# Altium project CarnLog-26.PrjPcb (part 1 of 2)
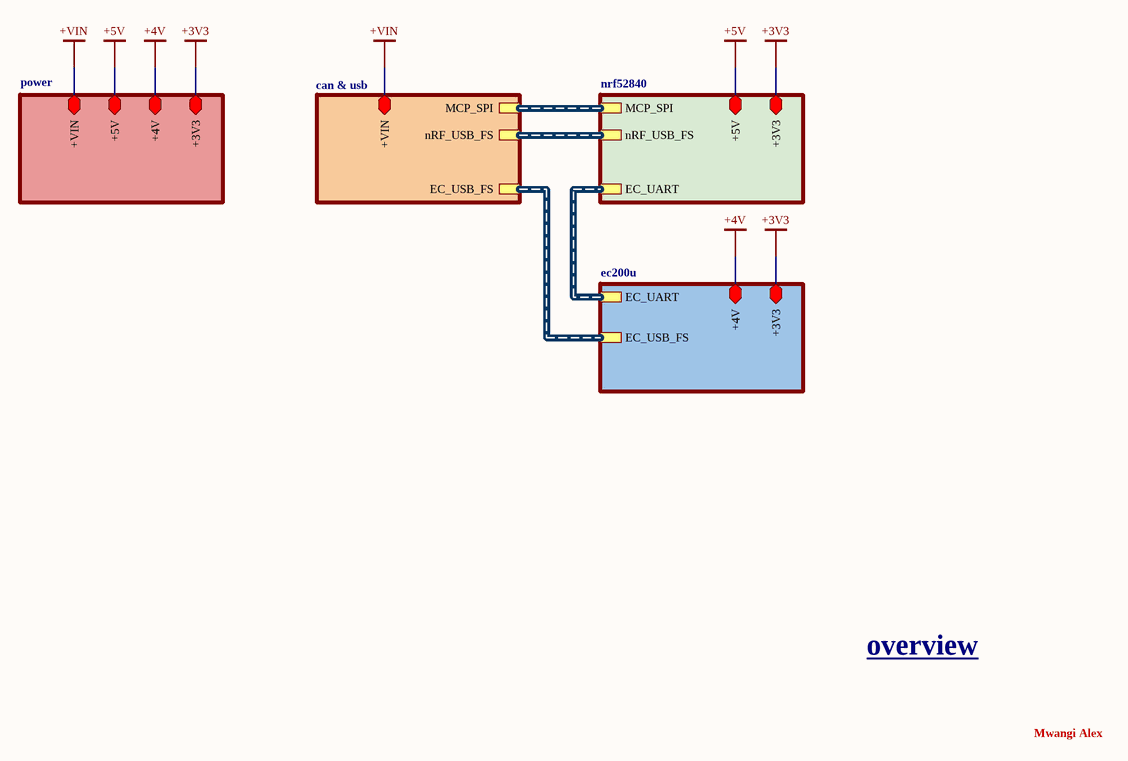
[diagram p0: overview.SchDoc]
5 sheets, 195 parts. Net scope: hierarchical (ports join the sheet entries above them; power ports are global).
Board file: CarnLog-26.PcbDoc
Sheets:
  overview.SchDoc
    power = pwr.SchDoc
    can & usb = can&usb.SchDoc
    nrf52840 = nrf52840.SchDoc
    ec200u = ec200u.SchDoc

## Sheet overview.SchDoc
size A4; SheetNumber: 1; SheetTotal: 5

### Sub-sheets
can & usb = can&usb.SchDoc: MCP_SPI (harness CAN_UART), +VIN (bidir), nRF_USB_FS (harness nRF_USB_FS), EC_USB_FS (harness EC_USB_FS)
ec200u = ec200u.SchDoc: EC_UART (harness EC_UART), +3V3 (bidir), +4V (bidir), EC_USB_FS (harness EC_USB_FS)
nrf52840 = nrf52840.SchDoc: EC_UART (harness EC_UART), MCP_SPI (harness CAN_UART), +3V3 (bidir), nRF_USB_FS (harness nRF_USB_FS), +5V (bidir)
power = pwr.SchDoc: +3V3 (bidir), +5V (bidir), +4V (bidir), +VIN (bidir)

### Nets
+3V3: sheet power/+3V3, sheet nrf52840/+3V3, sheet ec200u/+3V3
+4V: sheet power/+4V, sheet ec200u/+4V
+5V: sheet power/+5V, sheet nrf52840/+5V
+VIN: sheet power/+VIN, sheet can & usb/+VIN

### Buses and harness runs
harness sheet can & usb/EC_USB_FS = sheet ec200u/EC_USB_FS
harness sheet can & usb/MCP_SPI = sheet nrf52840/MCP_SPI
harness sheet can & usb/nRF_USB_FS = sheet nrf52840/nRF_USB_FS
harness sheet ec200u/EC_UART = sheet nrf52840/EC_UART

### Notes on the sheet
- overview
- Mwangi Alex

## Sheet pwr.SchDoc
size OrCAD A; SheetNumber: 2; SheetTotal: 5
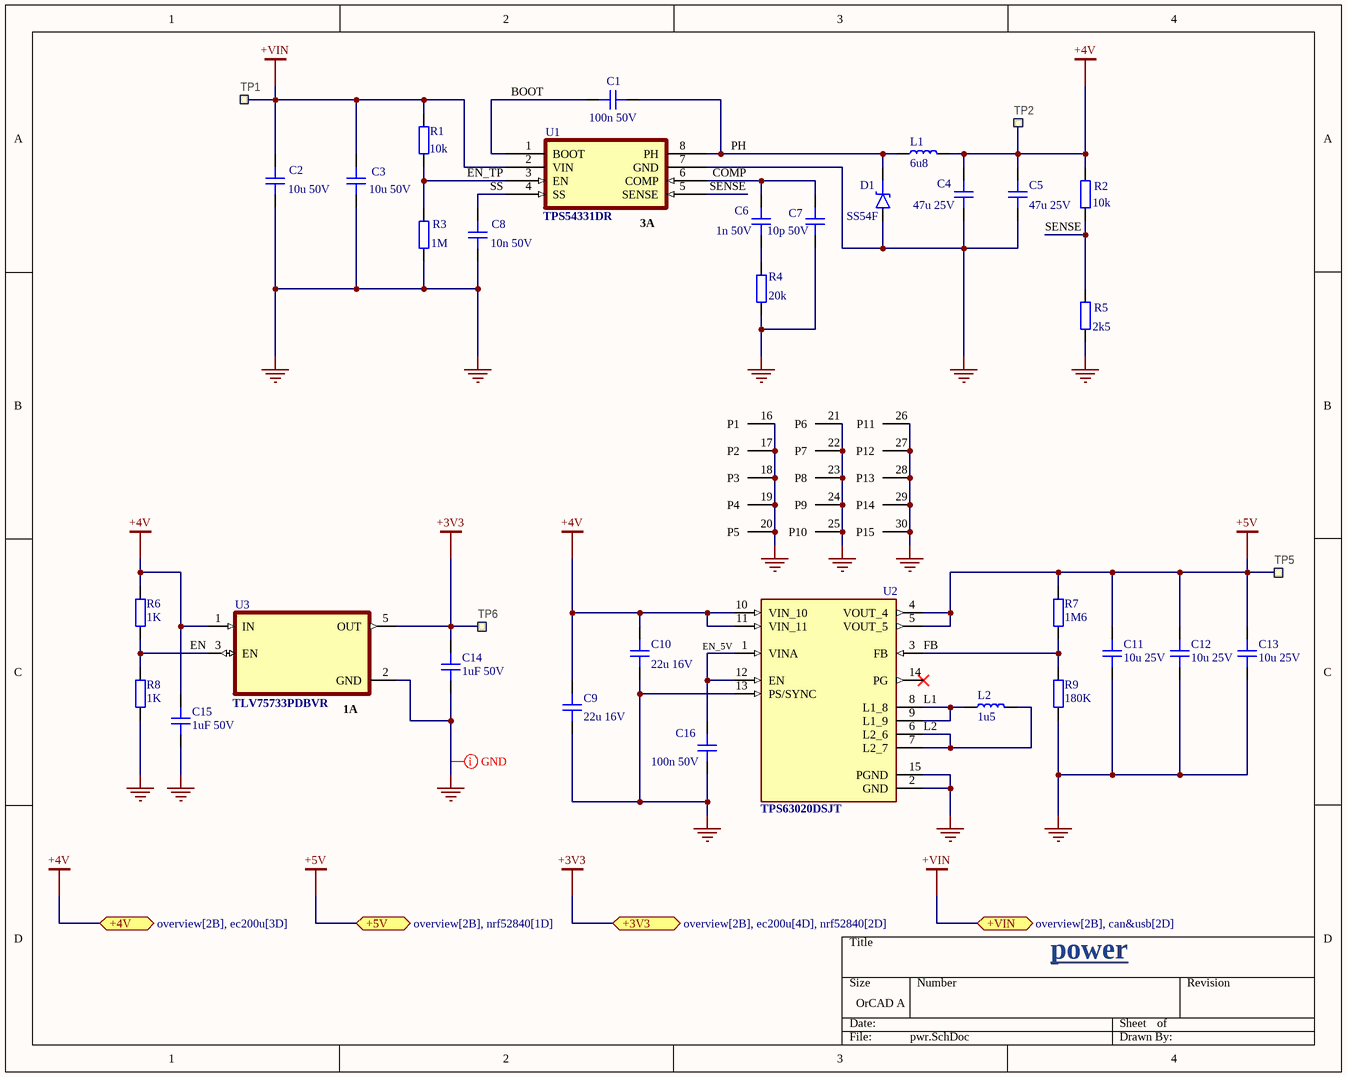
[diagram p1: pwr.SchDoc]

### Parts
C1  100n 50V  [CAP_0402]
C2  10u 50V  [CAP_1206]
C3  10u 50V  [CAP_1206]
C4  47u 25V  [CAP_1206]
C5  47u 25V  [CAP_1206]
C6  1n 50V  [CAP_0603]
C7  10p 50V  [CAP_0402]
C8  10n 50V  [CAP_0603]
C9  22u 16V  [CAP_0603]
C10  22u 16V  [CAP_0603]
C11  10u 25V  [CAP_0603]
C12  10u 25V  [CAP_0603]
C13  10u 25V  [CAP_0603]
C14  1uF 50V  [CAP_0603]
C15  1uF 50V  [CAP_0603]
C16  100n 50V  [CAP_0402]
D1  SS54F  [DIOM5226X100N]
L1  6u8  [ASPI-0630HI-6R8M-T15]
L2  1u5  [IND_1008]
R1  10k  [RES_0603]
R2  10k  [RES_0603]
R3  1M  [RES_0603]
R4  20k  [RES_0603]
R5  2k5  [RES_0603]
R6  1K  [RES_0603]
R7  1M6  [RES_0805]
R8  1K  [RES_0603]
R9  180K  [RES_0805]
TP1  Ø1.0mm,SMD  [TP_SMD_D1.0mm]  (value not drawn)  (no BOM)
TP2  Ø1.0mm,SMD  [TP_SMD_D1.0mm]  (value not drawn)  (no BOM)
TP5  Ø1.0mm,SMD  [TP_SMD_D1.0mm]  (value not drawn)  (no BOM)
TP6  Ø1.0mm,SMD  [TP_SMD_D1.0mm]  (value not drawn)  (no BOM)
U1  TPS54331DR  [SOIC127P599X175-8N]
U2  TPS63020DSJT  [IC_TPS63020DSJT]
U3  TLV75733PDBVR  [SOT95P280X145-5N]

### Ports
+3V3 (bidir, see overview[2B], ec200u[4D], nrf52840[2D]), +4V (bidir, see overview[2B], ec200u[3D]), +5V (bidir, see overview[2B], nrf52840[1D]), +VIN (bidir, see overview[2B], can&usb[2D])

### Nets
+3V3: C14.2 TP6.1 U3.5(OUT) ; port +3V3
+4V: C4.2 C5.2 C9.2 C10.2 C15.2 L1.2 R2.2 R6.2 TP2.1 U2.10(VIN_10) U2.11(VIN_11) U3.1(IN) ; port +4V
+5V: C11.2 C12.2 C13.2 R7.1 TP5.1 U2.4(VOUT_4) U2.5(VOUT_5) ; port +5V
+VIN: C2.2 C3.2 R1.2 TP1.1 U1.2(VIN) ; port +VIN
GND: C2.1 C3.1 C4.1 C5.1 C7.1 C8.1 C9.1 C10.1 C11.1 C12.1 C13.1 C14.1 C15.1 C16.1 D1.A R3.1 R4.1 R5.1 R8.1 R9.2 U1.7(GND) U2.2(GND) U2.13(PS/SYNC) U2.15(PGND) U2.16(P1) U2.17(P2) U2.18(P3) U2.19(P4) U2.20(P5) U2.21(P6) U2.22(P7) U2.23(P8) U2.24(P9) U2.25(P10) U2.26(P11) U2.27(P12) U2.28(P13) U2.29(P14) U2.30(P15) U3.2(GND)
BOOT: C1.2 U1.1(BOOT)
COMP: C6.2 C7.2 U1.6(COMP)
EN: R6.1 R8.2 U3.3(EN)
EN_5V: C16.2 U2.1(VINA) U2.12(EN)
EN_TP: R1.1 R3.2 U1.3(EN)
FB: R7.2 R9.1 U2.3(FB)
L1: L2.1 U2.8(L1_8) U2.9(L1_9)
L2: L2.2 U2.6(L2_6) U2.7(L2_7)
PH: C1.1 D1.K L1.1 U1.8(PH)
SENSE: R2.1 R5.2 U1.5(SENSE)
SS: C8.2 U1.4(SS)
NetC6_1: C6.1 R4.2

Not connected (* = marked no-connect by the designer): U2 14(PG)*

### Layout directives
rule Width Constraint [Pref Width = 0.5mm    Min Width = 0.2mm    Max Width = 0.5mm]; net class GND: GND

### Notes on the sheet
- (near U1) 3A
- (near U3) 1A
- power

### Library data of the parts
C1 C16 = CAP_0402: Capacitor SMD 0402; Manufacturer: Murata Electronics; MPN: GRM155R71H104KE14D; Distributor Link: *; LCSC NO: C77020; Rating: *; Dielectric: *; ComponentLink1Description: LCSC Link; ComponentLink1URL: https://lcsc.com/product-detail/Multilayer-Ceramic-Capacitors-MLCC-SMD-SMT_Murata-Electronics-GRM155R71H104KE14D_C77020.html?s_z=n_100nF
C2-C5 = CAP_1206: Capacitor SMD 1206; Manufacturer: *; Manufacturer Part Number: *; Distributor Link: *; LCSC: *; Rating: *; Dielectric: *
C6 C8-C15 = CAP_0603: Capacitor SMD 0603; Manufacturer: *; Manufacturer Part Number: *; Distributor Link: *; LCSC: *; Rating: *; Dielectric: *
C7 = CAP_0402: Capacitor SMD 0402; Manufacturer: *; Manufacturer Part Number: *; Distributor Link: *; LCSC: *; Rating: *; Dielectric: *
D1 = Schottky Diode_3: Schottky Diode SMD SMAF package
L1 = ASPI-0630HI-6R8M-T15: Inductor SMD 6.8uH 20% 8A Shielded; Manufacturer: ABRACON; Manufacturer Part Number: ASPI-0630HI-6R8M-T15
L2 = IND_1008: Inductor SMD 1008
R1-R6 R8 = RES_0603: Resistor SMD 0603; Manufacturer: *; Manufacturer Part Number: *; Distributor Link: *; LCSC: *
R7 R9 = RES_0805: Resistor SMD 0805; Manufacturer: *; Manufacturer Part Number: *; Distributor Link: *; LCSC: *
TP1 TP2 TP5 TP6 = TP_SMD_Ø1.0MM: 1.0mm circular SMD testpad; Manufacturer: Nordic Semiconductor; Manufacturer Part Number: N.A.; Part number NEMS: 100500475; Pad Count: 1; Component Status: Active; Part Number: TP_SMD_Ø1.0MM; ComponentLink1URL: N.A.; ComponentLink1Description: Datasheet; ComponentLink2URL: N.A.; ComponentLink2Description: Supplier link; HelpURL: N.A.; Footprint Doc: TP_SMD_Ø1.0mm; LatestRevisionDate: 2021-03-05; Published: 2013-06-11; Value: Ø1.0mm,SMD; Note: N.A.; Artikkelnr Noca: N.A.; Part number IPS: N.A.; Supplier 1: N.A.; Supplier Part Number 1: N.A.; Supplier 2: N.A.; Supplier Part Number 2: N.A.; PartId: 100500475; Component Class: Connectors; Author: rsk; Part number Norautron: N.A.
U2 = TPS63020DSJT: High Efficiency Single Inductor Buck-Boost Converter with 4A Switch; MF: Texas Instruments; SnapEDA_Link: https://www.snapeda.com/parts/TPS63020DSJT/Texas+Instruments/view-part/?ref=snap; Package: VSON-14 Texas Instruments; Value: *; MP: TPS63020DSJT; Check_prices: https://www.snapeda.com/parts/TPS63020DSJT/Texas+Instruments/view-part/?ref=eda
U3 = TLV75733PDBVR: 1-A, low-IQ, high-accuracy, low-dropout voltage regulator with enable; MF: Texas Instruments; Check_prices: https://www.snapeda.com/parts/TLV75733PDBVR/Texas+Instruments/view-part/?ref=eda; Value: *; Availability: In Stock; MP: TLV75733PDBVR; Price: None; Package: SOT-23-5 Texas Instruments; SnapEDA_Link: https://www.snapeda.com/parts/TLV75733PDBVR/Texas+Instruments/view-part/?ref=snap; Purchase-URL: https://pricing.snapeda.com/search/part/TLV75733PDBVR/?ref=eda

## Sheet can&usb.SchDoc
size 317 x 304 mm; SheetNumber: 4; SheetTotal: 5
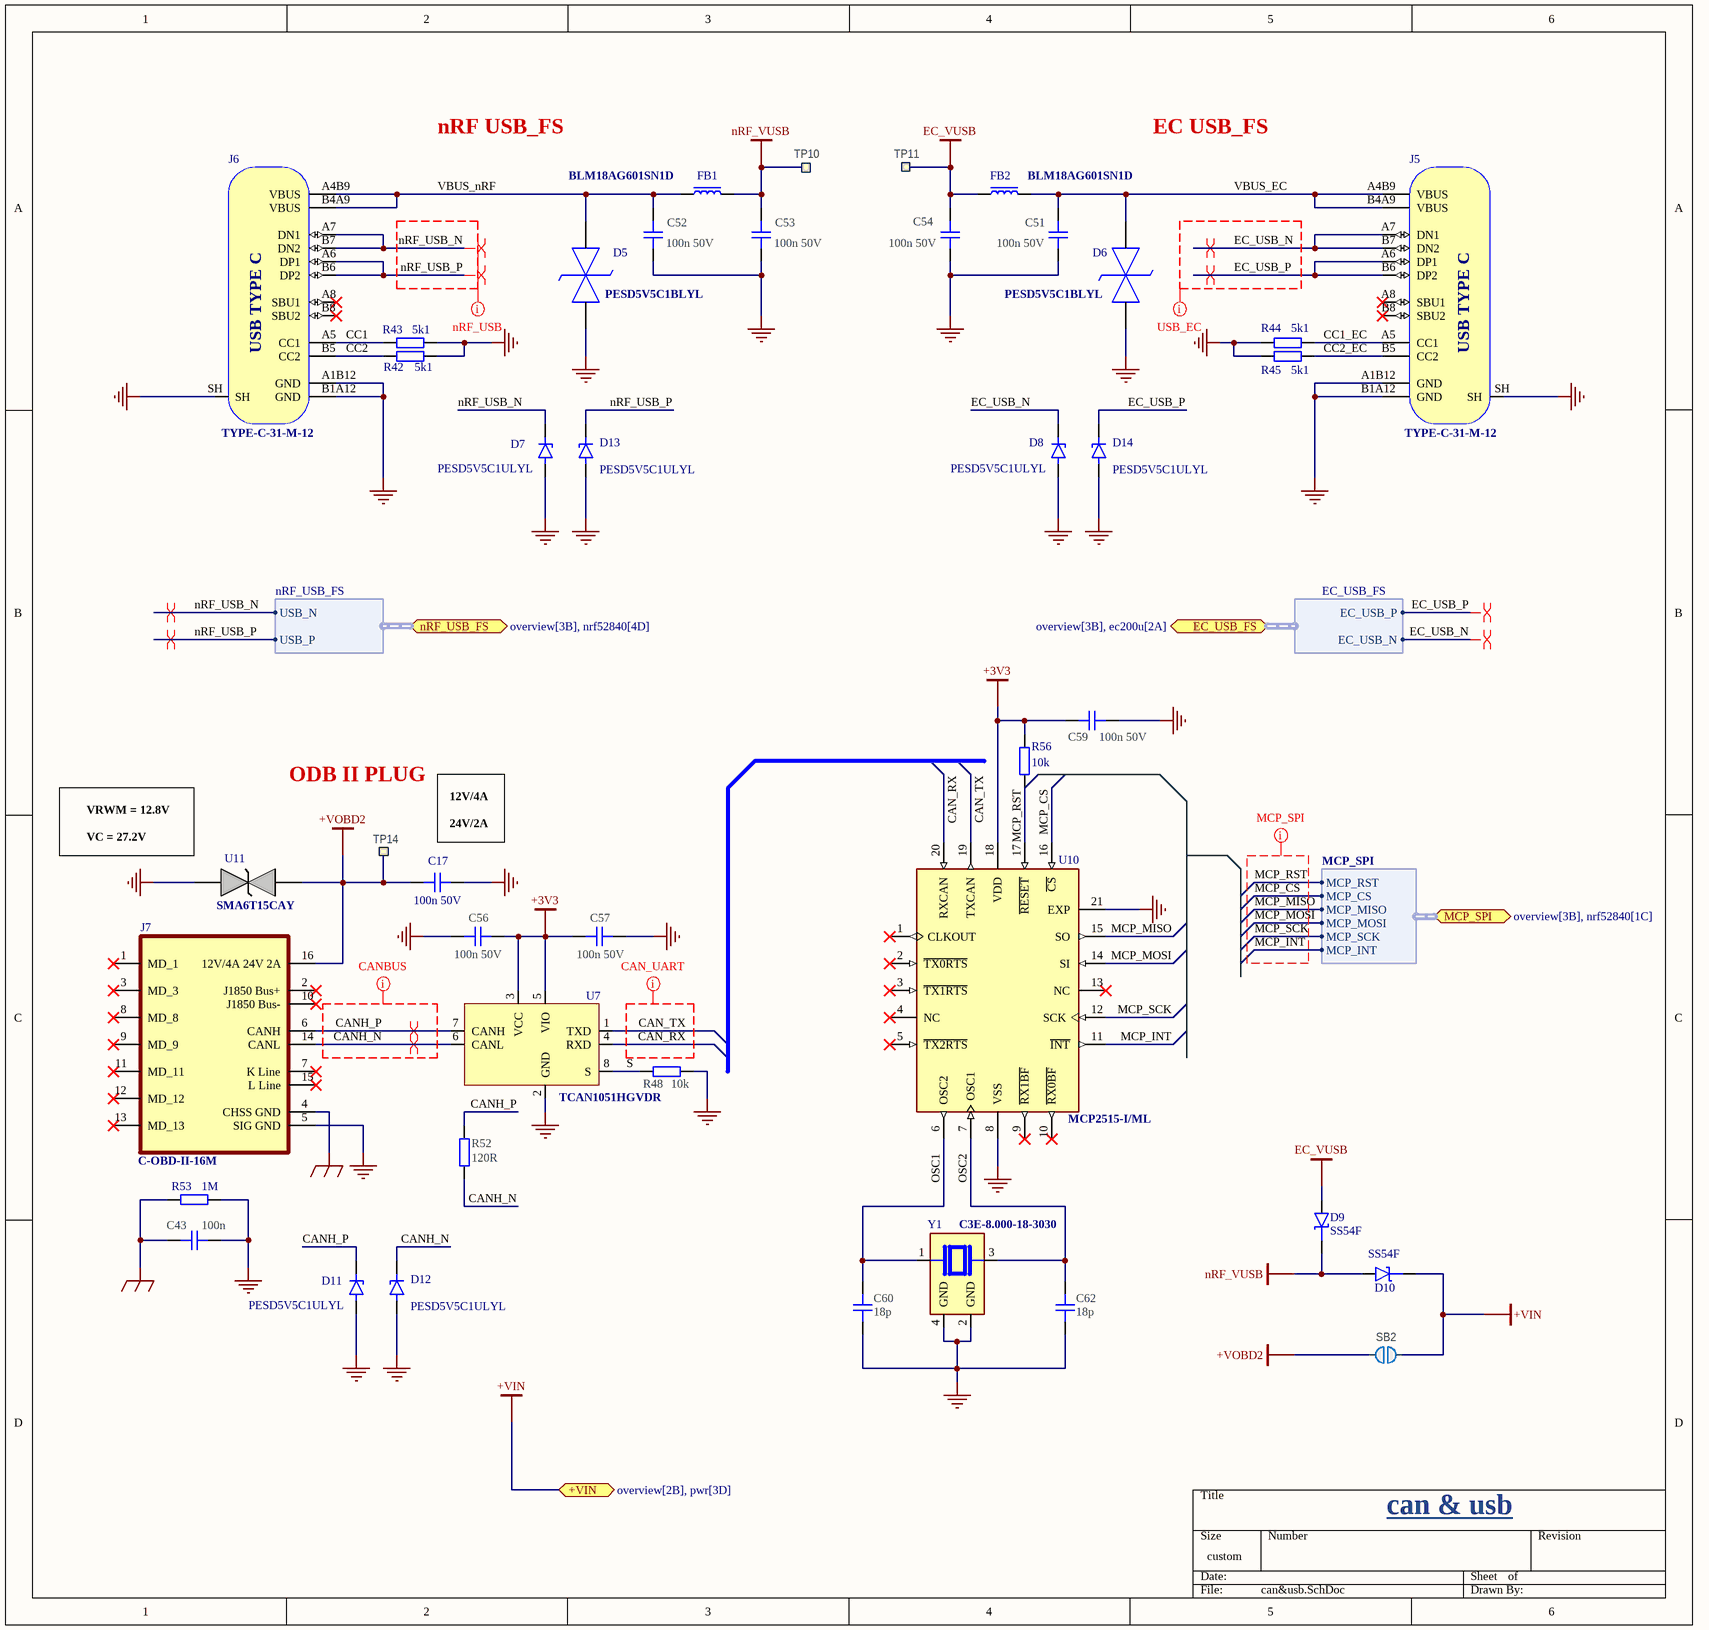
[diagram p2: can&usb.SchDoc]

### Parts
C17  100n 50V  [CAP_0805]
C43  100n  [CAPC2012X11L]
C51  100n 50V  [CAPC1005X04L]
C52  100n 50V  [CAPC1005X04L]
C53  100n 50V  [CAPC1005X04L]
C54  100n 50V  [CAPC1005X04L]
C56  100n 50V  [CAPC1005X04L]
C57  100n 50V  [CAPC1005X04L]
C59  100n 50V  [CAPC1005X04L]
C60  18p  [CAPC1005X04L]
C62  18p  [CAPC1005X04L]
D5  PESD5V5C1BLYL  [PESD5V5C1BLYL]
D6  PESD5V5C1BLYL  [PESD5V5C1BLYL]
D7  PESD5V5C1ULYL  [DIO_PESD5V5C1ULYL]
D8  PESD5V5C1ULYL  [DIO_PESD5V5C1ULYL]
D9  SS54F  [DIOM5226X100N]
D10  SS54F  [DIOM5226X100N]
D11  PESD5V5C1ULYL  [DIO_PESD5V5C1ULYL]
D12  PESD5V5C1ULYL  [DIO_PESD5V5C1ULYL]
D13  PESD5V5C1ULYL  [DIO_PESD5V5C1ULYL]
D14  PESD5V5C1ULYL  [DIO_PESD5V5C1ULYL]
FB1  BLM18AG601SN1D  [FB_0603]
FB2  BLM18AG601SN1D  [FB_0603]
J5  TYPE-C-31-M-12  [TYPE-C-31-M-12]
J6  TYPE-C-31-M-12  [TYPE-C-31-M-12]
J7  C-OBD-II-16M  [COMTECH_C-OBD-II-16M]
R42  5k1  [RES_0603]
R43  5k1  [RES_0603]
R44  5k1  [RES_0603]
R45  5k1  [RES_0603]
R48  10k  [RESC1005X04L]
R52  120R  [RESC1005X04L]
R53  1M  [RES_0603]
R56  10k  [RES_0603]
SB2  Solderbridge  [Solderbridge]  (value not drawn)  (no BOM)
TP10  Ø1.0mm,SMD  [TP_SMD_D1.0mm]  (value not drawn)  (no BOM)
TP11  Ø1.0mm,SMD  [TP_SMD_D1.0mm]  (value not drawn)  (no BOM)
TP14  Ø1.5mm,SMD  [TP_SMD_D1.5mm]  (value not drawn)  (no BOM)
U7  TCAN1051HGVDR  [SOIC-8]
U10  MCP2515-I/ML  [QFN50P400X400X100-21N]
U11  SMA6T15CAY  [SMA_BI_STM]
Y1  C3E-8.000-18-3030  [XTAL_C3E-8.000-18-3030-X-R]

### Ports
+VIN (bidir, see overview[2B], pwr[3D]), EC_USB_FS (bidir, harness EC_USB_FS, see overview[3B], ec200u[2A]), MCP_SPI (bidir, harness MCP_SPI, see overview[3B], nrf52840[1C]), nRF_USB_FS (bidir, harness nRF_USB_FS, see overview[3B], nrf52840[4D])

### Harnesses
nRF_USB_FS: USB_N, USB_P
EC_USB_FS: EC_USB_N, EC_USB_P
MCP_SPI: MCP_RST, MCP_CS, MCP_MISO, MCP_MOSI, MCP_SCK, MCP_INT

### Nets
+3V3: C56.1 C57.2 C59.2 R56.1 U7.3(VCC) U7.5(VIO) U10.18(VDD)
+VIN: D10.K SB2.1 ; port +VIN
+VOBD2: C17.2 J7.16(12V/4A_24V_2A) SB2.2 TP14.1 U11.2
C_GND: C43.1 J7.4(CHSS_GND) R53.1
EC_VUSB: C54.1 D9.A FB2.1 TP11.1
GND: C17.1 C43.2 C51.2 C52.2 C53.2 C54.2 C56.2 C57.1 C59.1 C60.1 C62.1 D5.2(K2) D6.2(K2) D7.A D8.A D11.A D12.A D13.A D14.A J5.A1B12(GND) J5.B1A12(GND) J5.SH J6.A1B12(GND) J6.B1A12(GND) J6.SH J7.5(SIG_GND) R42.1 R43.1 R44.1 R45.1 R48.2 R53.2 U7.2(GND) U10.8(VSS) U10.21(EXP) U11.1 Y1.2(GND) Y1.4(GND)
nRF_VUSB: C53.1 D9.K D10.A FB1.1 TP10.1
CAN_RX: U7.4(RXD) U10.20(RXCAN)
CAN_TX: U7.1(TXD) U10.19(TXCAN)
CANH_N: D12.K J7.14(CANL) R52.2 U7.6(CANL)
CANH_P: D11.K J7.6(CANH) R52.1 U7.7(CANH)
CC1: J6.A5(CC1) R43.2
CC1_EC: J5.A5(CC1) R44.2
CC2: J6.B5(CC2) R42.2
CC2_EC: J5.B5(CC2) R45.2
EC_USB_N: D8.K J5.A7(DN1) J5.B7(DN2) ; port EC_USB_FS.EC_USB_N
EC_USB_P: D14.K J5.A6(DP1) J5.B6(DP2) ; port EC_USB_FS.EC_USB_P
MCP_CS: U10.16(~{CS}) ; port MCP_SPI.MCP_CS
MCP_INT: U10.11(~{INT}) ; port MCP_SPI.MCP_INT
MCP_MISO: U10.15(SO) ; port MCP_SPI.MCP_MISO
MCP_MOSI: U10.14(SI) ; port MCP_SPI.MCP_MOSI
MCP_RST: R56.2 U10.17(~{RESET}) ; port MCP_SPI.MCP_RST
MCP_SCK: U10.12(SCK) ; port MCP_SPI.MCP_SCK
nRF_USB_N: D7.K J6.A7(DN1) J6.B7(DN2) ; port nRF_USB_FS.USB_N
nRF_USB_P: D13.K J6.A6(DP1) J6.B6(DP2) ; port nRF_USB_FS.USB_P
OSC1: C60.2 U10.6(OSC2) Y1.1
OSC2: C62.2 U10.7(OSC1) Y1.3
S: R48.1 U7.8(S)
VBUS_EC: C51.1 D6.1(K1) FB2.2 J5.A4B9(VBUS) J5.B4A9(VBUS)
VBUS_nRF: C52.1 D5.1(K1) FB1.2 J6.A4B9(VBUS) J6.B4A9(VBUS)

Not connected (* = marked no-connect by the designer): J5 A8(SBU1)* B8(SBU2)*; J6 A8(SBU1)* B8(SBU2)*; J7 1(MD_1)* 2(J1850_Bus+)* 3(MD_3)* 7(K_Line)* 8(MD_8)* 9(MD_9)* 10(J1850_Bus-)* 11(MD_11)* 12(MD_12)* 13(MD_13)* 15(L_Line)*; U10 1(CLKOUT)* 2(~{TX0RTS})* 3(~{TX1RTS})* 4(NC)* 5(~{TX2RTS})* 9(~{RX1BF})* 10(~{RX0BF})* 13(NC)*

### Layout directives
differential pair: CANH_N, CANH_P, EC_USB_N, EC_USB_P, nRF_USB_N, nRF_USB_P
net class CANBUS: CANH_N, CANH_P
net class CAN_UART: CAN_RX, CAN_TX
net class nRF_USB: nRF_USB_N, nRF_USB_P
net class USB_EC: EC_USB_N, EC_USB_P
mark named MCP_SPI: MCP_CS, MCP_INT, MCP_MISO, MCP_MOSI, MCP_RST, MCP_SCK

### Notes on the sheet
- nRF USB_FS
- EC USB_FS
- ODB II PLUG
- 12V/4A
  24V/2A
- (near U11) VRWM = 12.8V
  VC = 27.2V
- can & usb
- (in symbol TYPE-C-31-M-12) USB TYPE C

### Library data of the parts
C17 = CAP_0805: Capacitor SMD 0805; Manufacturer: *; Manufacturer Part Number: *; Distributor Link: *; LCSC: *; Rating: *; Dielectric: *
C43 = C0805-4µ7: Capacitor, X5R, ±10%, 16V; Manufacturer: N.A.; Part number IPS: 00000006289; Part number NEMS: 100200284; Value: 4.7µF; Artikkelnr Noca: 20039266; Pad Count: 2; Component Status: Active; Part Number: C0805-4µ7; Manufacturer Part Number: N.A.; ComponentLink1URL: N.A.; ComponentLink1Description: Datasheet; ComponentLink2URL: N.A.; ComponentLink2Description: Supplier link; HelpURL: N.A.; Footprint Doc: 0805; LatestRevisionDate: 2020-04-28; Published: 2009-08-21; Note: 16V; Supplier 1: N.A.; Supplier Part Number 1: N.A.; Supplier 2: N.A.; Supplier Part Number 2: N.A.; PartId: 100200284; Component Class: Capacitors; Author: rsk; Part number Norautron: N.A.
C51-C54 C56 C57 C59 C60 C62 = C0402-4µ7: Capacitor, X5R, ±20%; Manufacturer: N.A.; Part number IPS: 00000001251, 00000007165; Part number NEMS: 100200193; Value: 4.7µF; Note: 10V; Artikkelnr Noca: 20039482; Pad Count: 2; Component Status: Active; Part Number: C0402-4µ7; Manufacturer Part Number: N.A.; ComponentLink1URL: N.A.; ComponentLink1Description: Datasheet; ComponentLink2URL: N.A.; ComponentLink2Description: Supplier link; HelpURL: N.A.; Footprint Doc: 0402; LatestRevisionDate: 2017-11-09; Published: 2009-05-08; Supplier 1: Digi-Key; Supplier Part Number 1: 490-13252-1-ND; Supplier 2: N.A.; Supplier Part Number 2: N.A.; PartId: 100200193; Component Class: Capacitors; Author: rsk; Part number Norautron: N.A.
D5 D6 = PESD5V5C1BLYL: PESD5V5C1BL - Extremely low clamping bidirectional ESD protection diode@en-us; Manufacturer_Name: Nexperia; Geometry.Height: 0.5mm; Manufacturer_Part_Number: PESD5V5C1BLYL; Mouser Part Number: 771-PESD5V5C1BLYL; Mouser Price/Stock: https://www.mouser.co.uk/ProductDetail/Nexperia/PESD5V5C1BLYL?qs=3Rah4i%252BhyCFwc8nZBq0KPQ%3D%3D; Arrow Part Number: PESD5V5C1BLYL; Arrow Price/Stock: https://www.arrow.com/en/products/pesd5v5c1blyl/nexperia?utm_currency=USD&region=nac; Datasheet Link: https://assets.nexperia.com/documents/data-sheet/PESD5V0S1BA_BB_BL.pdf
D7 D8 D11-D14 = PESD5V5C1ULYL: Esd Protection Device, 5.5V, Dfn1006 Rohs Compliant: Yes |Nexperia PESD5V5C1ULYL; MF: Nexperia USA Inc.; SnapEDA_Link: https://www.snapeda.com/parts/PESD5V5C1ULYL/Nexperia/view-part/?ref=snap; Package: SOD-882 Nexperia USA; Value: *; MP: PESD5V5C1ULYL; Check_prices: https://www.snapeda.com/parts/PESD5V5C1ULYL/Nexperia/view-part/?ref=eda
D9 D10 = Schottky Diode_3: Schottky Diode SMD SMAF package
FB1 FB2 = FB_0603: Ferrite Bead SMD 0603; Manufacturer: *; Manufacturer Part Number: *; Distributor Link: *; LCSC: *
J5 J6 = TYPE-C-31-M-12: USB Type C Connector Horizontal SMT; Manufacturer: Koren Hroparts; Manufacturer Part Number: TYPE-C-31-M-12
J7 = C-OBD-II-16M: OBD II 16pin 90 Degree Angle Male Plug Connector; MF: Comtech Electronic Co., LTD; SnapEDA_Link: https://www.snapeda.com/parts/C-OBD-II-16M/Comtech+Electronic+Co.%252C+LTD/view-part/?ref=snap; Package: None; Value: *; MP: C-OBD-II-16M; Check_prices: https://www.snapeda.com/parts/C-OBD-II-16M/Comtech+Electronic+Co.%252C+LTD/view-part/?ref=eda
R42-R45 R53 R56 = RES_0603: Resistor SMD 0603; Manufacturer: *; Manufacturer Part Number: *; Distributor Link: *; LCSC: *
R48 R52 = R0402-0R: Resistor, ±5%, 0.063W; Manufacturer: N.A.; Part number IPS: 00000007128; Part number NEMS: 100100109; Value: 0R; Note: Chip Res 5%; Artikkelnr Noca: 27049000; Pad Count: 2; Component Status: Active; Part Number: R0402-0R; Manufacturer Part Number: N.A.; ComponentLink1URL: N.A.; ComponentLink1Description: Datasheet; ComponentLink2URL: N.A.; ComponentLink2Description: Supplier link; HelpURL: N.A.; Footprint Doc: 0402; LatestRevisionDate: 2009-11-23; Published: 2009-05-08; Supplier 1: Farnell; Supplier Part Number 1: 146-9661; Supplier 2: N.A.; Supplier Part Number 2: N.A.; PartId: 100100109; Component Class: Resistors; Author: rsk; Part number Norautron: N.A.
SB2 = Solderbridge: Manufacturer: N.A.; Part number NEMS: 100500458; Pad Count: 2; Component Status: Active; System: Connector; Part Number: Solderbridge; Manufacturer Part Number: N.A.; LatestRevisionDate: 2009-12-14; Published: 2009-12-14; Value: Solderbridge; Note: N.A.; Artikkelnr Noca: N.A.; Footprint Doc: Solderbridge; Part number IPS: N.A.; ComponentLink1URL: N.A.; ComponentLink1Description: Datasheet; ComponentLink2URL: N.A.; ComponentLink2Description: Supplier link; HelpURL: N.A.; Supplier 1: N.A.; Supplier Part Number 1: N.A.; Supplier 2: N.A.; Supplier Part Number 2: N.A.; PartId: 100500458; Component Class: Connectors; Author: rsk; Part number Norautron: N.A.
TP10 TP11 = TP_SMD_Ø1.0MM: as TP1 on sheet pwr; Part Number: TP_SMD_Ø1.0MM; ComponentLink1URL: N.A.; ComponentLink1Description: Datasheet; ComponentLink2URL: N.A.; ComponentLink2Description: Supplier link; HelpURL: N.A.; Footprint Doc: TP_SMD_Ø1.0mm; LatestRevisionDate: 2021-03-05; Published: 2013-06-11; Value: Ø1.0mm,SMD; Note: N.A.; Artikkelnr Noca: N.A.; Part number IPS: N.A.; Supplier 1: N.A.; Supplier Part Number 1: N.A.; Supplier 2: N.A.; Supplier Part Number 2: N.A.; PartId: 100500475; Component Class: Connectors; Author: rsk; Part number Norautron: N.A.
TP14 = TP_SMD_Ø1.5MM: 1.5mm circular SMD testpad; Manufacturer: Nordic Semiconductor; Manufacturer Part Number: N.A.; Part number NEMS: 100500477; Pad Count: 1; Component Status: Active; Part Number: TP_SMD_Ø1.5MM; ComponentLink1URL: N.A.; ComponentLink1Description: Datasheet; ComponentLink2URL: N.A.; ComponentLink2Description: Supplier link; HelpURL: N.A.; Footprint Doc: TP_SMD_Ø1.5mm; LatestRevisionDate: 2021-03-05; Published: 2016-06-02; Value: Ø1.5mm,SMD; Note: N.A.; Artikkelnr Noca: N.A.; Part number IPS: N.A.; Supplier 1: N.A.; Supplier Part Number 1: N.A.; Supplier 2: N.A.; Supplier Part Number 2: N.A.; PartId: 100500477; Component Class: Connectors; Author: rsk; Part number Norautron: N.A.
U7 = TCAN1051HGVDR: 5Mbps CAN Transceiver SOIC-8 CAN Transceivers ROHS
U10 = MCP2515-I/ML: Microchip MCP2515-I/ML, CAN Controller 1Mbit/s CAN 2.0B, 20-Pin QFN | Microchip Technology Inc. MCP2515-I/ML; SnapEDA_Link: https://www.snapeda.com/parts/MCP2515-I/ML/Microchip+Technology/view-part/?ref=snap; Package: VFQFN-20 Microchip; Value: *; MF: Microchip Technology; MP: MCP2515-I/ML; Check_prices: https://www.snapeda.com/parts/MCP2515-I/ML/Microchip+Technology/view-part/?ref=eda
U11 = SMA6T15CAY: Automotive 600 W, 12.8 V TVS in SMA; Manufacturer_Name: STMicroelectronics; Copyright: Copyright (C) 2026 Ultra Librarian. All rights reserved.; Manufacturer_Part_Number: SMA6T15CAY; Datasheet: https://www.st.com/resource/en/datasheet/sma6ty.pdf; Digi-Key_Part_Number_1: 497-11826-2-ND; Digi-Key_Part_Number_2: 497-11826-1-ND; Digi-Key_Part_Number_3: 497-11826-6-ND; RefDes: RefDes; Type: Type
Y1 = C3E-8.000-18-3030-X-R: Crystal, 3.20mm x2.50mm,8MHz,18pF,-40-85C; MF: Aker Technology USA; SnapEDA_Link: https://www.snapeda.com/parts/C3E-8.000-18-3030-X-R/Aker/view-part/?ref=snap; Package: SMD-4 Aker; Value: *; MP: C3E-8.000-18-3030-X-R; Check_prices: https://www.snapeda.com/parts/C3E-8.000-18-3030-X-R/Aker/view-part/?ref=eda

## Sheet nrf52840.SchDoc
size 381 x 241 mm; SheetNumber: 5; SheetTotal: 5
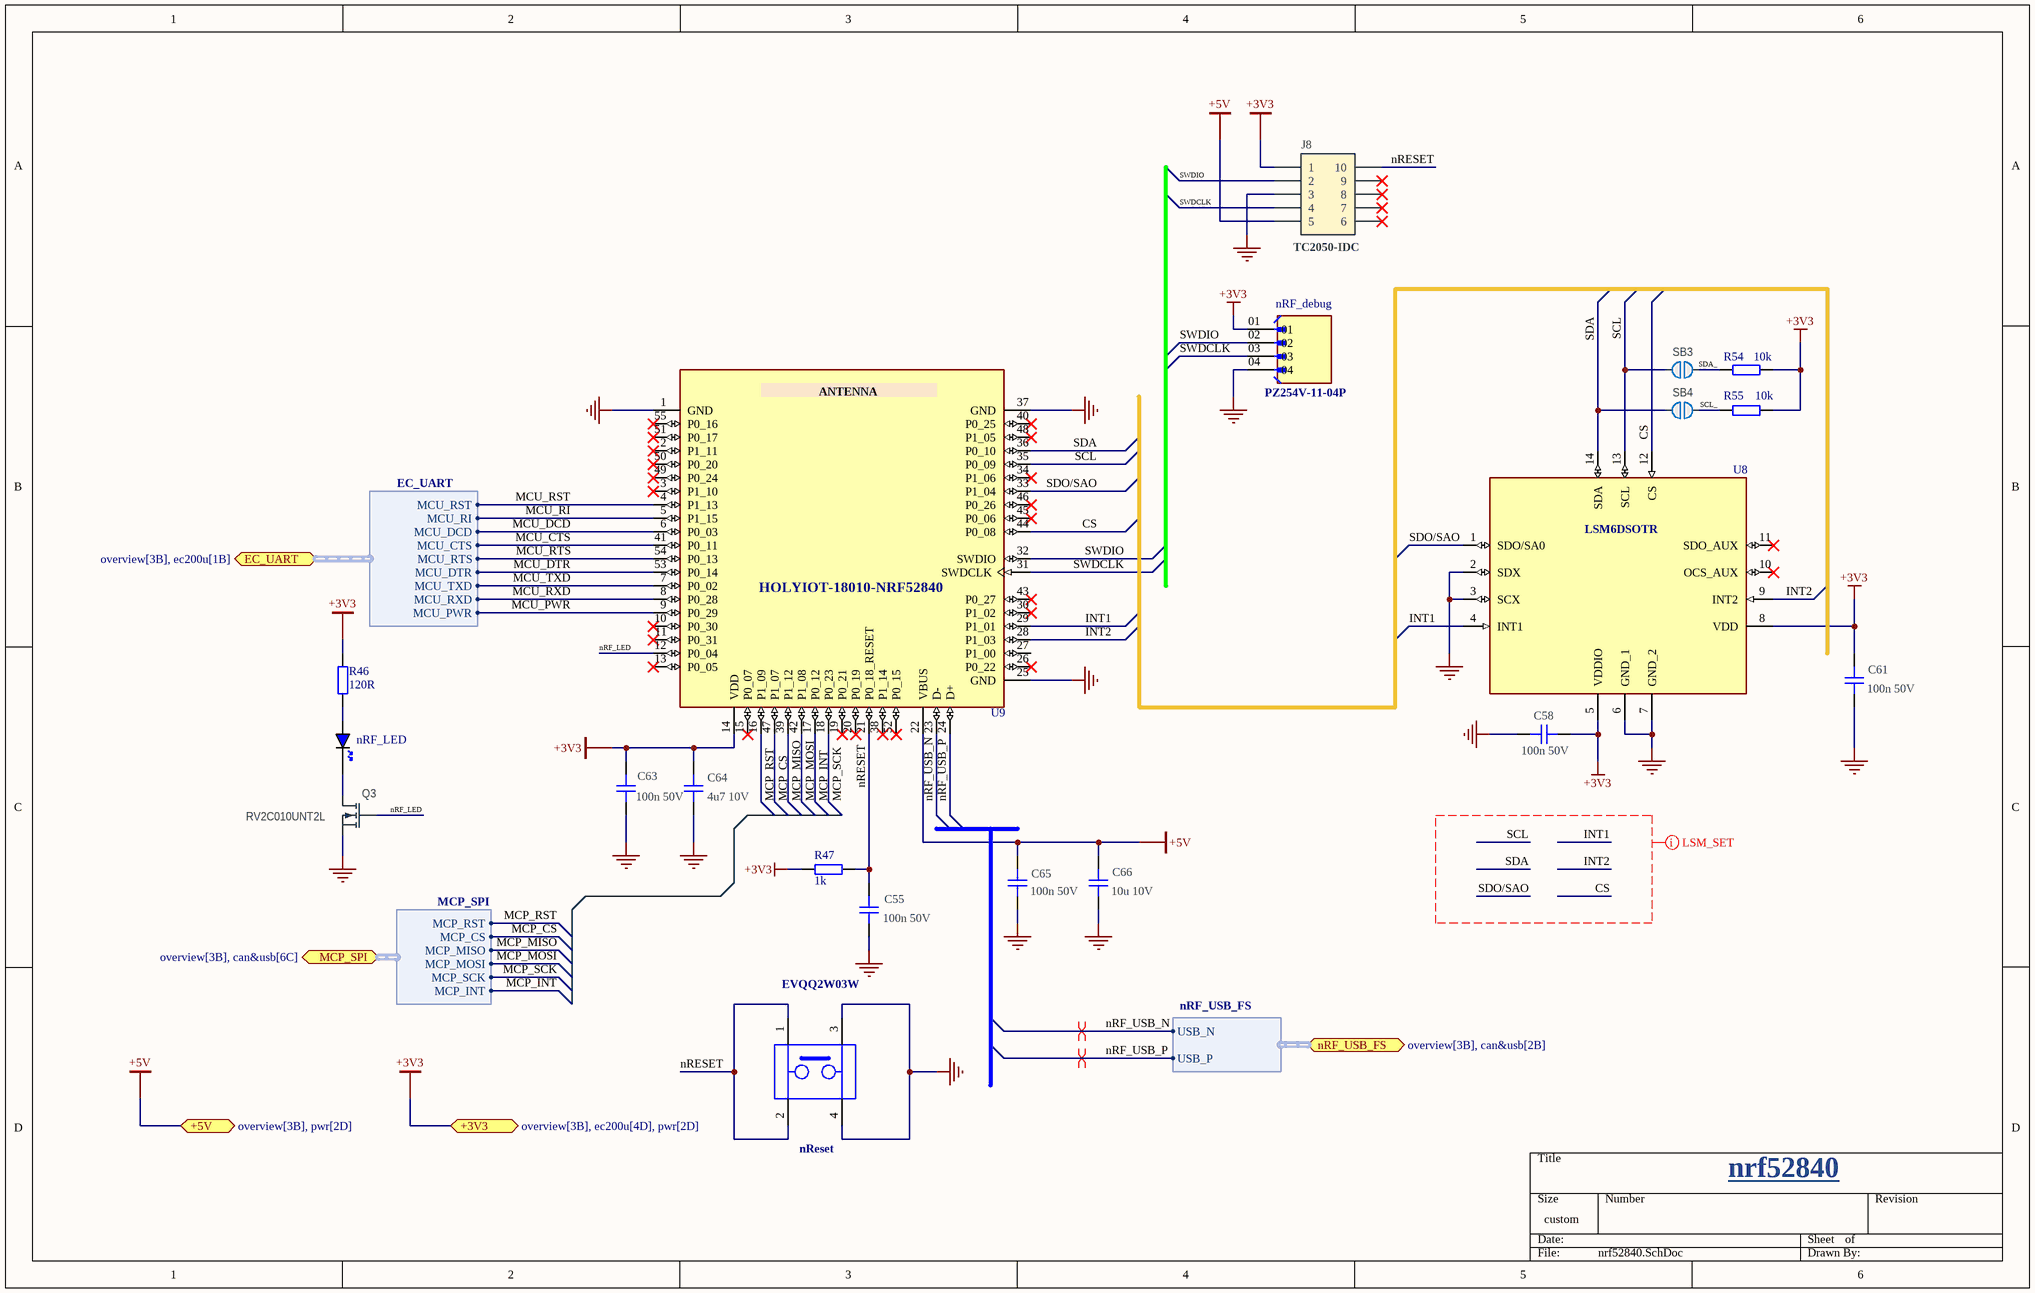
[diagram p3: nrf52840.SchDoc]

### Parts
C55  100n 50V  [CAPC1005X04L]
C58  100n 50V  [CAPC1005X04L]
C61  100n 50V  [CAPC1005X04L]
C63  100n 50V  [CAPC1005X04L]
C64  4u7 10V  [CAPC1005X04L]
C65  100n 50V  [CAPC1005X04L]
C66  10u 10V  [CAPC1005X04L]
J8  TC2050-IDC  [TC2050-IDC-NLFP]  (no BOM)
nReset  EVQQ2W03W  [EVQQ2W03W]
nRF_debug  PZ254V-11-04P  [SAMTEC_TSW-104-08-T-S-LL]
nRF_LED  BLUE  [LED_0603_BLUE]  (value not drawn)
Q3  RV2C010UNT2L  [DFN65P100X40-3L]
R46  120R  [RES_0603]
R47  1k  [RES_0603]
R54  10k  [RES_0603]
R55  10k  [RES_0603]
SB3  Solderbridge  [Solderbridge]  (value not drawn)  (no BOM)
SB4  Solderbridge  [Solderbridge]  (value not drawn)  (no BOM)
U8  LSM6DSOTR  [LSM6DSOTR]
U9  HOLYIOT-18010-NRF52840  [XCVR_HOLYIOT-18010-NRF52840]

### Ports
+3V3 (bidir, see overview[3B], ec200u[4D], pwr[2D]), +5V (bidir, see overview[3B], pwr[2D]), EC_UART (bidir, harness EC_UART, see overview[3B], ec200u[1B]), MCP_SPI (bidir, harness MCP_SPI, see overview[3B], can&usb[6C]), nRF_USB_FS (bidir, harness nRF_USB_FS, see overview[3B], can&usb[2B])

### Harnesses
EC_UART: MCU_RI, MCU_DCD, MCU_CTS, MCU_RTS, MCU_DTR, MCU_TXD, MCU_RXD, MCU_RST, MCU_PWR
nRF_USB_FS: USB_N, USB_P
MCP_SPI: MCP_RST, MCP_CS, MCP_MISO, MCP_MOSI, MCP_SCK, MCP_INT

### Nets
+3V3: C58.2 C61.1 C63.2 C64.2 J8.1 nRF_debug.01 R46.2 R47.1 R54.2 R55.2 U8.5(VDDIO) U8.8(VDD) U9.14(VDD) ; port +3V3
+5V: C65.2 C66.2 J8.5 U9.22(VBUS) ; port +5V
GND: C55.1 C58.1 C61.2 C63.1 C64.1 C65.1 C66.1 J8.3 nReset.3 nReset.4 nRF_debug.04 Q3.2(S) U8.2(SDX) U8.3(SCX) U8.6(GND_1) U8.7(GND_2) U9.1(GND) U9.25(GND) U9.37(GND)
CS: U8.12(CS) U9.44(P0_08)
INT1: U8.4(INT1) U9.29(P1_01)
INT2: U8.9(INT2) U9.28(P1_03)
MCP_CS: U9.47(P1_07) ; port MCP_SPI.MCP_CS
MCP_INT: U9.17(P0_12) ; port MCP_SPI.MCP_INT
MCP_MISO: U9.39(P1_12) ; port MCP_SPI.MCP_MISO
MCP_MOSI: U9.42(P1_08) ; port MCP_SPI.MCP_MOSI
MCP_RST: U9.16(P1_09) ; port MCP_SPI.MCP_RST
MCP_SCK: U9.18(P0_23) ; port MCP_SPI.MCP_SCK
MCU_CTS: U9.41(P0_11) ; port EC_UART.MCU_CTS
MCU_DCD: U9.6(P0_03) ; port EC_UART.MCU_DCD
MCU_DTR: U9.53(P0_14) ; port EC_UART.MCU_DTR
MCU_PWR: U9.9(P0_29) ; port EC_UART.MCU_PWR
MCU_RI: U9.5(P1_15) ; port EC_UART.MCU_RI
MCU_RST: U9.4(P1_13) ; port EC_UART.MCU_RST
MCU_RTS: U9.54(P0_13) ; port EC_UART.MCU_RTS
MCU_RXD: U9.8(P0_28) ; port EC_UART.MCU_RXD
MCU_TXD: U9.7(P0_02) ; port EC_UART.MCU_TXD
nRESET: C55.2 J8.10 nReset.1 nReset.2 R47.2 U9.21(P0_18_RESET)
nRF_LED: Q3.1(G) U9.12(P0_04)
nRF_USB_N: U9.23(D-) ; port nRF_USB_FS.USB_N
nRF_USB_P: U9.24(D+) ; port nRF_USB_FS.USB_P
SCL: SB3.2 U8.13(SCL) U9.35(P0_09)
SCL_: R55.1 SB4.1
SDA: SB4.2 U8.14(SDA) U9.36(P0_10)
SDA_: R54.1 SB3.1
SDO/SAO: U8.1(SDO/SA0) U9.33(P1_04)
SWDCLK: J8.4 nRF_debug.03 U9.31(SWDCLK)
SWDIO: J8.2 nRF_debug.02 U9.32(SWDIO)
NetnRF_LED_A: nRF_LED.A R46.1
NetnRF_LED_K: nRF_LED.K Q3.3(D)

Not connected (* = marked no-connect by the designer): J8 6* 7* 8* 9*; U8 10(OCS_AUX)* 11(SDO_AUX)*; U9 2(P1_11)* 3(P1_10)* 10(P0_30)* 11(P0_31)* 13(P0_05)* 15(P0_07)* 19(P0_21)* 20(P0_19)* 26(P0_22)* 27(P1_00) 30(P1_02)* 34(P1_06)* 38(P1_14)* 40(P0_25)* 43(P0_27)* 45(P0_06)* 46(P0_26)* 48(P1_05)* 49(P0_24)* 50(P0_20)* 51(P0_17)* 52(P0_15)* 55(P0_16)*

### Layout directives
differential pair: nRF_USB_N, nRF_USB_P
net class LSM_SET: CS, INT1, INT2, SCL, SDA, SDO/SAO

### Notes on the sheet
- nrf52840
- (in symbol HOLYIOT-18010-NRF52840) ANTENNA

### Library data of the parts
C55 C58 C61 C63 C65 = C0402-4µ7: as C51 on sheet can&usb; Part Number: C0402-4µ7; Manufacturer Part Number: N.A.; ComponentLink1URL: N.A.; ComponentLink1Description: Datasheet; ComponentLink2URL: N.A.; ComponentLink2Description: Supplier link; HelpURL: N.A.; Footprint Doc: 0402; LatestRevisionDate: 2017-11-09; Published: 2009-05-08; Supplier 1: Digi-Key; Supplier Part Number 1: 490-13252-1-ND; Supplier 2: N.A.; Supplier Part Number 2: N.A.; PartId: 100200193; Component Class: Capacitors; Author: rsk; Part number Norautron: N.A.
C64 C66 = C0402-4µ7: Capacitor, X5R, ±20%; Manufacturer: N.A.; Part number IPS: 00000001251, 00000007165; Part number NEMS: 100200193; Value: 4.7µF; Artikkelnr Noca: 20039482; Pad Count: 2; Component Status: Active; Part Number: C0402-4µ7; Manufacturer Part Number: N.A.; ComponentLink1URL: N.A.; ComponentLink1Description: Datasheet; ComponentLink2URL: N.A.; ComponentLink2Description: Supplier link; HelpURL: N.A.; Footprint Doc: 0402; LatestRevisionDate: 2017-11-09; Published: 2009-05-08; Note: 10V; Supplier 1: Digi-Key; Supplier Part Number 1: 490-13252-1-ND; Supplier 2: N.A.; Supplier Part Number 2: N.A.; PartId: 100200193; Component Class: Capacitors; Author: rsk; Part number Norautron: N.A.
J8 = TC2050-IDC-NLFP: CBL PLUG-OF-NAILS 10-PIN; Manufacturer: Tag-Connect LLC; Part number NEMS: 100500463; Artikkelnr Noca: N.A.; Pad Count: 10; Component Status: Active; System: Connector; Part Number: TC2050-IDC-NLFP; Manufacturer Part Number: TC2050-IDC-NLFP; LatestRevisionDate: 2012-11-21; Published: 2012-11-21; Value: TC2050-IDC; Footprint Doc: TC2050-IDC-NLFP; Part number IPS: N.A.; ComponentLink1URL: N.A.; ComponentLink1Description: Datasheet; ComponentLink2URL: N.A.; ComponentLink2Description: Supplier link; HelpURL: http://www.tag-connect.com/Materials/TC2050-IDC%20Datasheet.pdf; Supplier 1: Digi-Key; Supplier Part Number 1: TC2050-IDC-NL-ND; Supplier 2: N.A.; Supplier Part Number 2: N.A.; PartId: 100500463; Component Class: Connectors; Note: N.A.; Author: rsk; Part number Norautron: N.A.
nReset = EVQQ2W03W: White Push Plate Tactile Switch, SPST-NO 20 mA 3.1mm; MF: Panasonic; Package: None; Check_prices: https://www.snapeda.com/parts/EVQQ2W03W/Panasonic/view-part/?ref=eda; SnapEDA_Link: https://www.snapeda.com/parts/EVQQ2W03W/Panasonic/view-part/?ref=snap; Price: None; Availability: In Stock; MP: EVQQ2W03W; Value: *
nRF_debug = 4PIN_TSW-104-08-T-S-LL: MF: Samtec; Availability: Unavailable; Value: *; Package: None; Price: None; MP: TSW-104-08-T-S-LL
nRF_LED = LED_0603_BLUE: LED 0603 BLUE SMD
Q3 = RV2C010UNT2L: N-Channel MOSFET, 20V, 1A, 470mOhm, 400mW; Manufacturer: Rohm Semiconductor; Part number IPS: 00000009976; Part number Norautron: 26320026; Part number NEMS: 101300132; Note: N.A.; Artikkelnr Noca: 35010020; Pad Count: 3; Component Status: Active; Part Number: RV2C010UNT2L; Manufacturer Part Number: RV2C010UNT2L; ComponentLink1URL: N.A.; ComponentLink1Description: Datasheet; ComponentLink2URL: N.A.; ComponentLink2Description: Supplier link; HelpURL: http://rohmfs.rohm.com/en/products/databook/datasheet/discrete/transistor/mosfet/rv2c010unt2l-e.pdf; Footprint Doc: DFN-3; LatestRevisionDate: 2016-08-09; Published: 2016-08-09; Value: RV2C010UNT2L; Supplier 1: Digi-Key; Supplier Part Number 1: RV2C010UNT2LCT-ND; Supplier 2: Mouser; Supplier Part Number 2: 755-RV2C010UNT2L; PartId: 101300132; Component Class: Semiconductors; Author: rsk
R46 R47 R54 R55 = RES_0603: Resistor SMD 0603; Manufacturer: *; Manufacturer Part Number: *; Distributor Link: *; LCSC: *
SB3 SB4 = Solderbridge: as SB2 on sheet can&usb; Part Number: Solderbridge; Manufacturer Part Number: N.A.; LatestRevisionDate: 2009-12-14; Published: 2009-12-14; Value: Solderbridge; Note: N.A.; Artikkelnr Noca: N.A.; Footprint Doc: Solderbridge; Part number IPS: N.A.; ComponentLink1URL: N.A.; ComponentLink1Description: Datasheet; ComponentLink2URL: N.A.; ComponentLink2Description: Supplier link; HelpURL: N.A.; Supplier 1: N.A.; Supplier Part Number 1: N.A.; Supplier 2: N.A.; Supplier Part Number 2: N.A.; PartId: 100500458; Component Class: Connectors; Author: rsk; Part number Norautron: N.A.
U8 = LSM6DSOTR: Accelerometer, Gyroscope, 6 Axis Sensor I2C, SPI Output; MF: STMicroelectronics; SnapEDA_Link: https://www.snapeda.com/parts/LSM6DSOTR/STMicroelectronics/view-part/?ref=snap; Package: VFLGA-14 STMicroelectronics; Value: *; MP: LSM6DSOTR; Check_prices: https://www.snapeda.com/parts/LSM6DSOTR/STMicroelectronics/view-part/?ref=eda
U9 = HOLYIOT-18010-NRF52840: Holyiot 18010 Nordic nRF52840 module Bluetooth low energy module; SnapEDA_Link: https://www.snapeda.com/parts/HOLYIOT-18010-NRF52840/Holyiot/view-part/?ref=snap; Package: Package; Value: *; MF: Holyiot; MP: HOLYIOT-18010-NRF52840; Check_prices: https://www.snapeda.com/parts/HOLYIOT-18010-NRF52840/Holyiot/view-part/?ref=eda